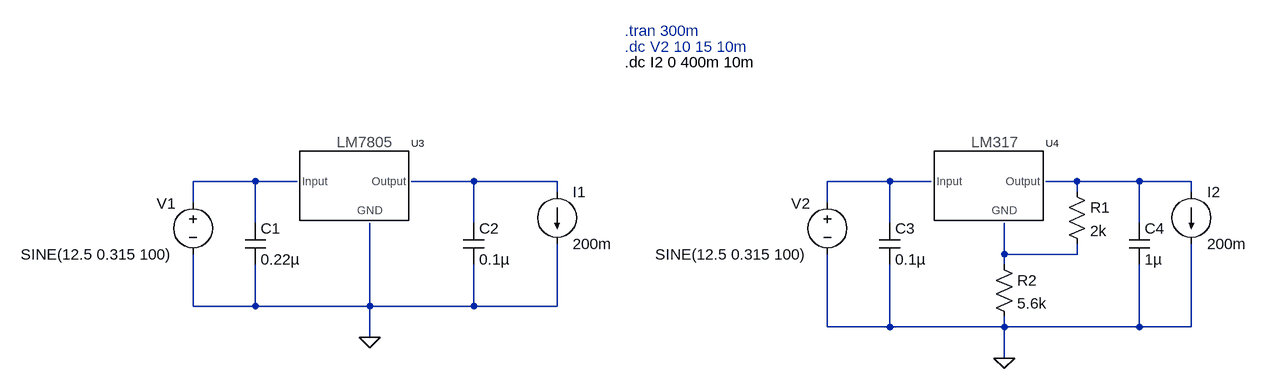
[diagram p0: schematic Stabilizator_liniar_IC.asc]
Stabilizator_liniar_IC.asc, the LTspice schematic file:
Version 4.1
SHEET 1 2268 2212
WIRE 128 416 32 416
WIRE 192 416 128 416
WIRE 464 416 368 416
WIRE 592 416 464 416
WIRE 1104 416 1008 416
WIRE 1168 416 1104 416
WIRE 1392 416 1344 416
WIRE 1488 416 1392 416
WIRE 1568 416 1488 416
WIRE 592 432 592 416
WIRE 1392 432 1392 416
WIRE 1568 432 1568 416
WIRE 32 448 32 416
WIRE 1008 448 1008 416
WIRE 128 480 128 416
WIRE 464 480 464 416
WIRE 1104 480 1104 416
WIRE 1488 480 1488 416
WIRE 1280 528 1280 480
WIRE 1392 528 1392 512
WIRE 1392 528 1280 528
WIRE 1280 544 1280 528
WIRE 32 608 32 528
WIRE 128 608 128 544
WIRE 128 608 32 608
WIRE 304 608 304 480
WIRE 304 608 128 608
WIRE 464 608 464 544
WIRE 464 608 304 608
WIRE 592 608 592 512
WIRE 592 608 464 608
WIRE 1008 640 1008 528
WIRE 1104 640 1104 544
WIRE 1104 640 1008 640
WIRE 1280 640 1280 624
WIRE 1280 640 1104 640
WIRE 1488 640 1488 544
WIRE 1488 640 1280 640
WIRE 1568 640 1568 512
WIRE 1568 640 1488 640
WIRE 304 656 304 608
WIRE 1280 688 1280 640
FLAG 304 656 0
FLAG 1280 688 0
SYMBOL voltage 32 432 R0
WINDOW 0 -56 18 Left 2
WINDOW 3 -265 96 Left 2
WINDOW 123 0 0 Left 0
WINDOW 39 0 0 Left 0
SYMATTR InstName V1
SYMATTR Value SINE(12.5 0.315 100)
SYMBOL current 592 432 R0
SYMATTR InstName I1
SYMATTR Value 200m
SYMBOL cap 112 480 R0
SYMATTR InstName C1
SYMATTR Value 0.22µ
SYMBOL cap 448 480 R0
SYMATTR InstName C2
SYMATTR Value 0.1µ
SYMBOL LM7805 272 384 R0
SYMATTR InstName U3
SYMBOL voltage 1008 432 R0
WINDOW 0 -56 18 Left 2
WINDOW 3 -265 96 Left 2
WINDOW 123 0 0 Left 0
WINDOW 39 0 0 Left 0
SYMATTR InstName V2
SYMATTR Value SINE(12.5 0.315 100)
SYMBOL current 1568 432 R0
SYMATTR InstName I2
SYMATTR Value 200m
SYMBOL cap 1088 480 R0
SYMATTR InstName C3
SYMATTR Value 0.1µ
SYMBOL cap 1472 480 R0
SYMATTR InstName C4
SYMATTR Value 1µ
SYMBOL res 1376 416 R0
SYMATTR InstName R1
SYMATTR Value 2k
SYMBOL res 1264 528 R0
SYMATTR InstName R2
SYMATTR Value 5.6k
SYMBOL LM317 1248 384 R0
SYMATTR InstName U4
TEXT 696 184 Left 2 ;.tran 300m
TEXT 696 208 Left 2 ;.dc V2 10 15 10m
TEXT 696 232 Left 2 !.dc I2 0 400m 10m

The netlist it stands for:
* Stabilizator_liniar_IC.asc
V1 N001 0 SINE(12.5 0.315 100)
I1 N002 0 200m
C1 N001 0 0.22µ
C2 N002 0 0.1µ
X§U3 N001 0 N002 LM7805C LM7805C  ; pins Input GND Output
V2 N003 0 SINE(12.5 0.315 100)
I2 N004 0 200m
C3 N003 0 0.1µ
C4 N004 0 1µ
R1 N004 N005 2k
R2 N005 0 5.6k
X§U4 N003 N005 N004 LM317 LM317  ; pins Input GND Output
* .tran 300m
* .dc V2 10 15 10m
.dc I2 0 400m 10m
.lib 7805.txt
.lib 317.txt
.backanno
.end